# Altium schematic sheet LCD-Sheet.SchDoc
size A4; SheetNumber: 4; SheetTotal: 6
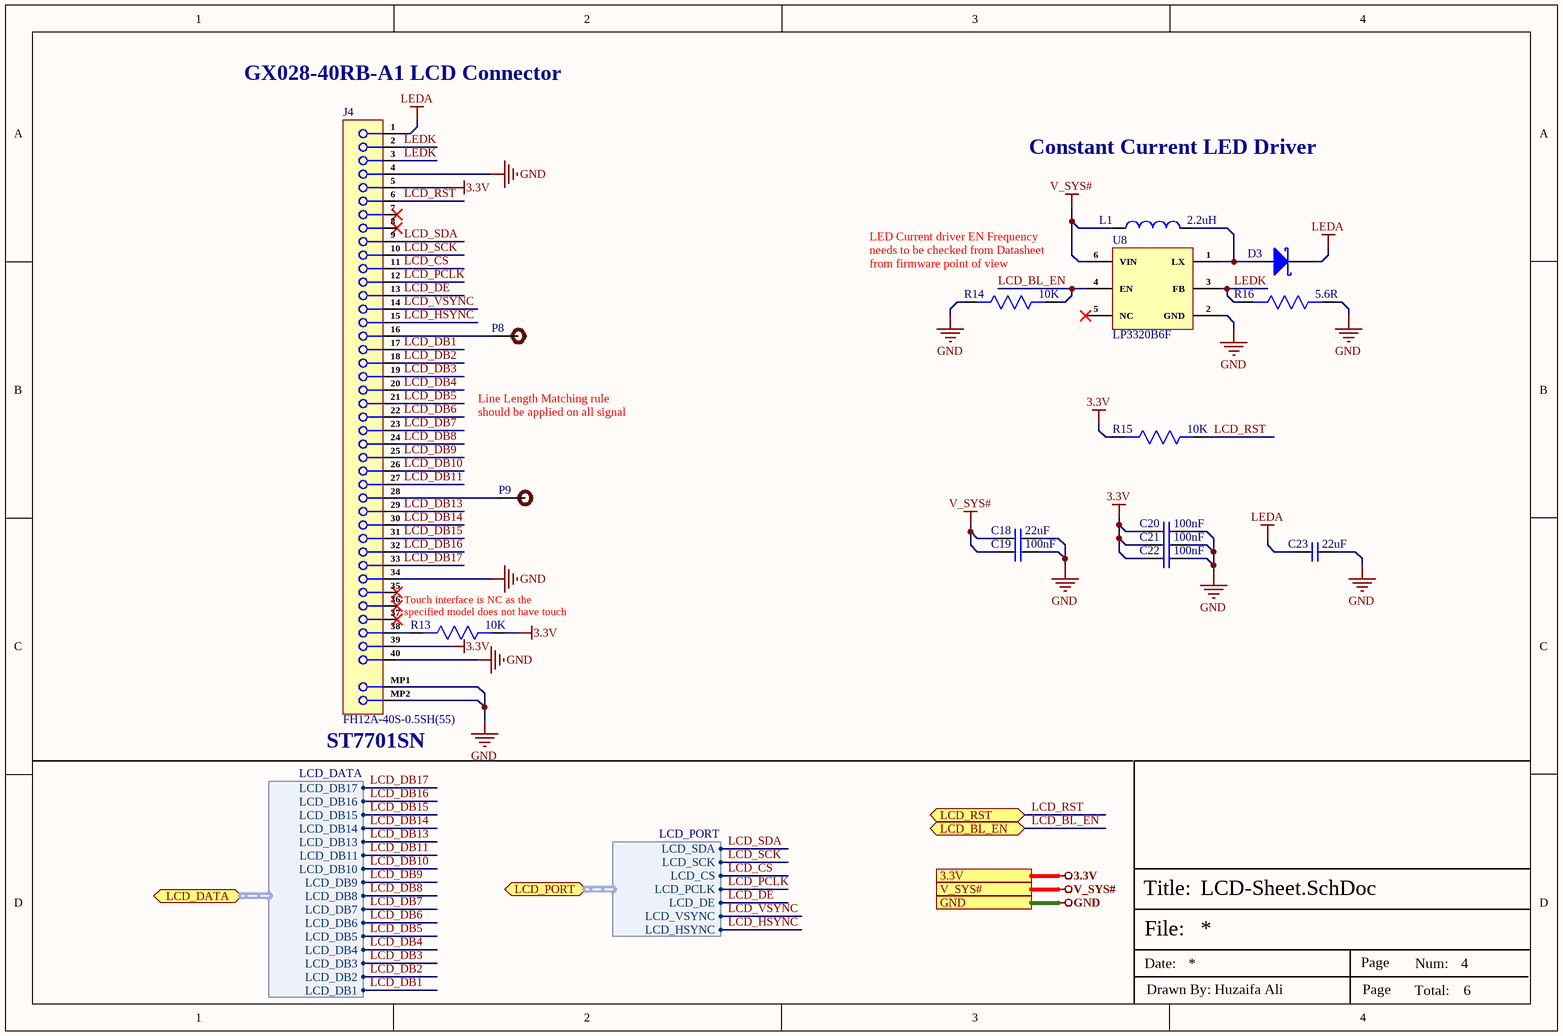
[diagram p0: LCD-Sheet.SchDoc]

## Parts
C18  22uF  [Cap-0805]
C19  100nF  [Cap-0402]
C20  100nF  [Cap-0402]
C21  100nF  [Cap-0402]
C22  100nF  [Cap-0402]
C23  22uF  [Cap-0805]
D3  DSK24 K24  [SOD-123FL]  (value not drawn)
J4  FH12A-40S-0.5SH(55)  [FH12A-40S-0.5SH(55)]
L1  2.2uH  [IHHP0806AZER2R2M01]
P8  TEST POINT  [Test-point]  (value not drawn)
P9  TEST POINT  [Test-point]  (value not drawn)
R13  10K  [Res-0603]
R14  10K  [Res-0603]
R15  10K  [Res-0603]
R16  5.6R  [Res-1206]
U8  LP3320B6F  [SOT-23-6]

## Ports
3.3V, GND, LCD_BL_EN (bidir), LCD_DATA (bidir, harness LCD_DATA), LCD_PORT (bidir, harness LCD_PORT), LCD_RST (bidir), V_SYS#

## Harnesses
LCD_PORT: LCD_SDA, LCD_SCK, LCD_CS, LCD_PCLK, LCD_DE, LCD_VSYNC, LCD_HSYNC
LCD_DATA: LCD_DB16, LCD_DB15, LCD_DB14, LCD_DB13, LCD_DB11, LCD_DB10, LCD_DB9, LCD_DB8, LCD_DB7, LCD_DB6, LCD_DB5, LCD_DB4, LCD_DB3, LCD_DB2, LCD_DB1, LCD_DB17

## Nets
3.3V: C20.1 C21.1 C22.1 J4.5 J4.39 R13.1 R15.2 ; port 3.3V
GND: C18.2 C19.2 C20.2 C21.2 C22.2 C23.2 J4.4 J4.34 J4.40 J4.MP1 J4.MP2 R14.2 R16.1 U8.2(GND) ; port GND
LEDA: C23.1 D3.1(K) J4.1
V_SYS#: C18.1 C19.1 L1.1 U8.6(VIN) ; port V_SYS#
LCD_BL_EN: R14.1 U8.4(EN) ; port LCD_BL_EN
LCD_CS: J4.11 ; port LCD_PORT.LCD_CS
LCD_DB1: J4.17 ; port LCD_DATA.LCD_DB1
LCD_DB2: J4.18 ; port LCD_DATA.LCD_DB2
LCD_DB3: J4.19 ; port LCD_DATA.LCD_DB3
LCD_DB4: J4.20 ; port LCD_DATA.LCD_DB4
LCD_DB5: J4.21 ; port LCD_DATA.LCD_DB5
LCD_DB6: J4.22 ; port LCD_DATA.LCD_DB6
LCD_DB7: J4.23 ; port LCD_DATA.LCD_DB7
LCD_DB8: J4.24 ; port LCD_DATA.LCD_DB8
LCD_DB9: J4.25 ; port LCD_DATA.LCD_DB9
LCD_DB10: J4.26 ; port LCD_DATA.LCD_DB10
LCD_DB11: J4.27 ; port LCD_DATA.LCD_DB11
LCD_DB13: J4.29 ; port LCD_DATA.LCD_DB13
LCD_DB14: J4.30 ; port LCD_DATA.LCD_DB14
LCD_DB15: J4.31 ; port LCD_DATA.LCD_DB15
LCD_DB16: J4.32 ; port LCD_DATA.LCD_DB16
LCD_DB17: J4.33 ; port LCD_DATA.LCD_DB17
LCD_DE: J4.13 ; port LCD_PORT.LCD_DE
LCD_HSYNC: J4.15 ; port LCD_PORT.LCD_HSYNC
LCD_PCLK: J4.12 ; port LCD_PORT.LCD_PCLK
LCD_RST: J4.6 R15.1 ; port LCD_RST
LCD_SCK: J4.10 ; port LCD_PORT.LCD_SCK
LCD_SDA: J4.9 ; port LCD_PORT.LCD_SDA
LCD_VSYNC: J4.14 ; port LCD_PORT.LCD_VSYNC
LEDK: J4.2 J4.3 R16.2 U8.3(FB)
NetD3_2: D3.2(A) L1.2 U8.1(LX)
NetJ4_16: J4.16 P8.1
NetJ4_28: J4.28 P9.1
NetJ4_38: J4.38 R13.2

Not connected (* = marked no-connect by the designer): J4 7* 8* 35* 36* 37*; U8 5(NC)*

## Notes on the sheet
- (near J4) GX028-40RB-A1 LCD Connector
- Constant Current LED Driver
- (near R14) LED Current driver EN Frequency needs to be checked from Datasheet from firmware point of view
- Line Length Matching rule should be applied on all signal traces
- Touch interface is NC as the specified model does not have touch interface
- (near J4) ST7701SN
- File:
- Title:
- Date:
- Page
- Num:
- Total:
- Drawn By: Huzaifa Ali

## Library data of the parts
C18 C23 = C2012X5R1V226MT000E: CAP CER 22UF 35V X5R 0805; Manufacturer: TDK Corporation; Manufacturer Part Number: C2012X5R1V226MT000E; Package: 0805; ComponentLink1Description: LCSC; ComponentLink1URL: https://www.lcsc.com/product-detail/Multilayer-Ceramic-Capacitors-MLCC-SMD-SMT_TDK-C2012X5R1V226M125AC_C2179409.html; LCSC Part Number: C338080
C19-C22 = CC0402KRX5R8BB104: CAP CER 0.1UF 25V X5R 0402; Manufacturer: Yageo; Tolerance: 10%; Item Type: Capacitor; Supplier 1: Digi-Key; Manufacturer Part Number: CC0402KRX5R8BB104; RoHS: Yes; Category: Ceramic Capacitors; Stock 1: 4598218; Pricing 1: 1=0.10000, 10=0.03800, 50=0.02100, 100=0.01710, 500=0.01224, 1000=0.00961, 2500=0.00874, 5000=0.00804 (USD); Mount: Surface Mount; Case/Package: 0402; Case Code (Metric): 1005; Case Code (Imperial): 0402; Min Operating Temperature: -55°C; Max Operating Temperature: 85°C; Voltage Rating: 25V; Packaging: Tape and Reel; Capacitance: 100nF; Voltage Rating (DC): 25V; Dielectric: X5R; Resistor Type: Ceramic; Series: CC; Length: 0.039inch; Width: 0.02inch; Thickness: 0.022inch; Depth: 0.5mm; Lead Free: Lead Free; Halogen Free: Halogen Free; RoHS Compliant: Yes; ComponentLink1URL: http://www.mouser.com/ds/2/447/UPY-GPHC_X5R_4V-to-50V_25-1131599.pdf?src-supplier=Mouser; ComponentLink1Description: http://www.mouser.com/ds/2/447/UPY-GPHC_X5R_4V-to-50V_25-1131599.pdf?src-supplier=Mouser; ComponentLink2URL: http://www.yageo.com/documents/recent/UPY-GPHC_X5R_4V-to-50V-16.pdf?src-supplier=Future+Electronics; ComponentLink2Description: http://www.yageo.com/documents/recent/UPY-GPHC_X5R_4V-to-50V-16.pdf?src-supplier=Future+Electronics; ComponentLink3URL: http://www.yageo.com/documents/recent/UPY-GPHC_X5R_4V-to-50V_25.pdf?src-supplier=Digi-Key; ComponentLink3Description: http://www.yageo.com/documents/recent/UPY-GPHC_X5R_4V-to-50V_25.pdf?src-supplier=Digi-Key; Supplier Part Number 1: 311-1697-1-ND; LCSC Part Number: C106256
D3 = DSK24 K24: 40V 550mV@2A 2A SOD-123FL Schottky Barrier Diodes (SBD) ROHS; Manufacturer: MDD; Item Type: Diode; Manufacturer Part Number: DSK24 K24; Package: SOD-123FL; LCSC Part Number: C64890; ComponentLink1Description: LCSC; ComponentLink1URL: https://www.lcsc.com/product-detail/Schottky-Barrier-Diodes-SBD_MDD-Microdiode-Electronics-DSK24-K24_C64890.html
J4 = FH12A-40S-0.5SH(55): CONN FFC TOP 40POS 0.50MM R/A; Manufacturer: Hirose; Connector Type: CARD EDGE CONNECTOR; Option: General Purpose; Contact Pattern: RECTANGULAR; Contact Style: BELLOWED TYPE; Filter Feature: No; Number Of PCB Rows: 1; Number of Contacts: 40; Board Mounting Option: SOLDER HOLDING POSTS; Contact Resistance: 50mR; Dielectric Withstanding Voltage (AC): 150V; Durability: 20Cycles; Insulation Resistance: 500MR; Rated Current (Signal): 500mA; Additional Feature: ROHS COMPLIANT; Body Breadth: 0.079inch; Body Length: 0.965inch; Mating Contact Pitch: 0.02inch; Mounting Option 1: LOCKING; Body Depth: 0.276inch; Reference Standard: UL; Reliability: COMMERCIAL; Supplier 1: Rs; Manufacturer Part Number: FH12A-40S-0.5SH(55); RoHS: Yes; Category: FFC / FPC; Stock 1: 1020; Pricing 1: 200=1.21900, 750=1.09200, 3000=0.99700, 6000=0.89700 (GBP); Mounting Technology: Board; Contact Material: Bronze; Contact Finish - Mating: GOLD (8); Contact Finish - Termination: Gold (Au) - with Nickel (Ni) barrier; Insulation Color: Beige; Insulation Material: Polyamide; Min Operating Temperature: -40°C; Max Operating Temperature: 85°C; JESD-609 Code: e4; Contact Gender: Female; Mixed Contacts: No; Mounting Style: RIGHT ANGLE; Number of Rows Loaded: 1; PCB Contact Pattern: RECTANGULAR; Termination: SMD/SMT; Terminal Pitch: 0.5mm; Flammability Rating: UL94 V-0; RoHS Compliant: Yes; DIN Conformance: No; IEC Conformance: No; MIL Conformance: No; Reach SVHC Compliant: Yes; ComponentLink1URL: https://datasheet.ciiva.com:443/pdfs/VipMasterIC/IC/HIRO/HIRO-S-A0001800623/HIRO-S-A0003173477-1.pdf?src-supplier=IHS+Markit; ComponentLink1Description: https://datasheet.ciiva.com:443/pdfs/VipMasterIC/IC/HIRO/HIRO-S-A0001800623/HIRO-S-A0003173477-1.pdf?src-supplier=IHS+Markit; ComponentLink2URL: https://datasheet.ciiva.com/14667/0900766b80806912-14667338.pdf?src-supplier=Rs; ComponentLink2Description: https://datasheet.ciiva.com/14667/0900766b80806912-14667338.pdf?src-supplier=Rs; ComponentLink3URL: https://datasheet.ciiva.com/15176/getdatasheetpartid-432540-15176844.pdf?src-supplier=Verical; ComponentLink3Description: https://datasheet.ciiva.com/15176/getdatasheetpartid-432540-15176844.pdf?src-supplier=Verical; ComponentLink4URL: https://datasheet.ciiva.com/11745/0900766b80d985fc-11745193.pdf?src-supplier=Rs; ComponentLink4Description: https://datasheet.ciiva.com/11745/0900766b80d985fc-11745193.pdf?src-supplier=Rs; Supplier Part Number 1: 6882839P
L1 = IHHP0806AZER2R2M01: FIXED IND 2.2UH 2A 158 MOHM SMD; Manufacturer: Vishay Dale; Inductor Type: GENERAL PURPOSE INDUCTOR; Item Type: Inductor; Supplier 1: Avnet; Manufacturer Part Number: IHHP0806AZER2R2M01; RoHS: Yes; Category: Fixed Inductors; Stock 1: 9000; Pricing 1: 3000=0.14871 (USD); RoHS Compliant: Yes; ComponentLink1URL: https://datasheet.ciiva.com:443/pdfs/VipMasterIC/IC/VISH/VISH-S-A0002932032/VISH-S-A0002932032-1.pdf?src-supplier=IHS+Markit; ComponentLink1Description: https://datasheet.ciiva.com:443/pdfs/VipMasterIC/IC/VISH/VISH-S-A0002932032/VISH-S-A0002932032-1.pdf?src-supplier=IHS+Markit; ComponentLink2URL: http://www.farnell.com/datasheets/1955141.pdf?src-supplier=Farnell; ComponentLink2Description: http://www.farnell.com/datasheets/1955141.pdf?src-supplier=Farnell; ComponentLink3URL: http://www.farnell.com/datasheets/1955141.pdf?src-supplier=Element14; ComponentLink3Description: http://www.farnell.com/datasheets/1955141.pdf?src-supplier=Element14; ComponentLink4URL: http://www.vishay.com/docs/34382/ihhp-0806az-01.pdf?src-supplier=Digi-Key; ComponentLink4Description: http://www.vishay.com/docs/34382/ihhp-0806az-01.pdf?src-supplier=Digi-Key; Supplier Part Number 1: IHHP0806AZER2R2M01; LCSC Part Number: C1330968
P8 P9 = TEST POINT: Test Point ON; Item Type: TEST POINT
R13-R15 = RC0603FR-0710KL: RES SMD 10K Ohm 1% 1/10W 0603; Manufacturer: Yageo; Resistance: 10kR; Temperature Coefficient: 100ppm/°C; Voltage Rating (DC): 50V; Power Rating: 100mW; Voltage Rating: 75V; Supplier 1: Digi-Key; Manufacturer Part Number: RC0603FR-0710KL; RoHS: Yes; Category: Chip SMD Resistors; Stock 1: 25249139; Pricing 1: 1=0.10000, 10=0.02400, 100=0.00970, 1000=0.00436, 2500=0.00378 (USD); Case/Package: 0603; Number of Pins: 2; Case Code (Imperial): 0603; Case Code (Metric): 1608; Weight: 7.1E-05oz; Size Code: 0603; Min Operating Temperature: -55°C; Max Operating Temperature: 155°C; Tolerance: 1%; Resistor Type: Thick Film; Packaging: Tape and Reel; Termination: SMD/SMT; Features: Moisture Resistant; Series: RC; Max Power Dissipation: 100mW; Number of Terminations: 2; Resistance Tolerance: 1%; Construction: Rectangular; Length: 1.6mm; Width: 0.8mm; Height: 0.45mm; Depth: 0.8mm; Lead Pitch: 0.3mm; REACH SVHC: Unknown; Lead Free: Lead Free; Military Standard: Not; RoHS Compliant: Yes; ComponentLink1URL: https://datasheet.ciiva.com/7660/38590-7660789.pdf?src-supplier=Element14; ComponentLink1Description: https://datasheet.ciiva.com/7660/38590-7660789.pdf?src-supplier=Element14; ComponentLink2URL: https://datasheet.ciiva.com/7983/443971-7983596.pdf?src-supplier=Element14; ComponentLink2Description: https://datasheet.ciiva.com/7983/443971-7983596.pdf?src-supplier=Element14; ComponentLink3URL: https://datasheet.ciiva.com/22747/443971-22747519.pdf?src-supplier=Element14; ComponentLink3Description: https://datasheet.ciiva.com/22747/443971-22747519.pdf?src-supplier=Element14; ComponentLink4URL: https://datasheet.ciiva.com/46440/1868787-46440891.pdf?src-supplier=Element14; ComponentLink4Description: https://datasheet.ciiva.com/46440/1868787-46440891.pdf?src-supplier=Element14; ComponentLink5URL: https://datasheet.ciiva.com/7746/1738695-7746239.pdf?src-supplier=Element14; ComponentLink5Description: https://datasheet.ciiva.com/7746/1738695-7746239.pdf?src-supplier=Element14; ComponentLink6URL: https://datasheet.ciiva.com/15189/getdatasheetpartid-409289-15189591.pdf?src-supplier=Verical; ComponentLink6Description: https://datasheet.ciiva.com/15189/getdatasheetpartid-409289-15189591.pdf?src-supplier=Verical; Supplier Part Number 1: 311-10.0KHRCT-ND; LCSC Part Number: C98220
R16 = RC1206FR-7W5R6L: General Purpose Chip Resistor Thick Film 1206 5.6Ohm 1% Paper T/R; Manufacturer: Yageo; Supplier 1: Avnet; Manufacturer Part Number: RC1206FR-7W5R6L; RoHS: No; Category: Resistors; Pricing 1: 5000=0.02037, 10000=0.02008, 20000=0.01950 (USD); Supplier Part Number 1: RC1206FR-7W5R6L; LCSC Part Number: C137211; Item Type: Resistor
U8 = LP3320B6F: SOT-23-6 AC-DC Controllers & Regulators ROHS; Manufacturer: LOWPOWER; Item Type: IC; Manufacturer Part Number: LP3320B6F; Package: SOT-23-6; LCSC Part Number: C387699; ComponentLink1Description: LCSC; ComponentLink1URL: https://www.lcsc.com/product-detail/AC-DC-Controllers-Regulators_LOWPOWER-LP3320B6F_C387699.html